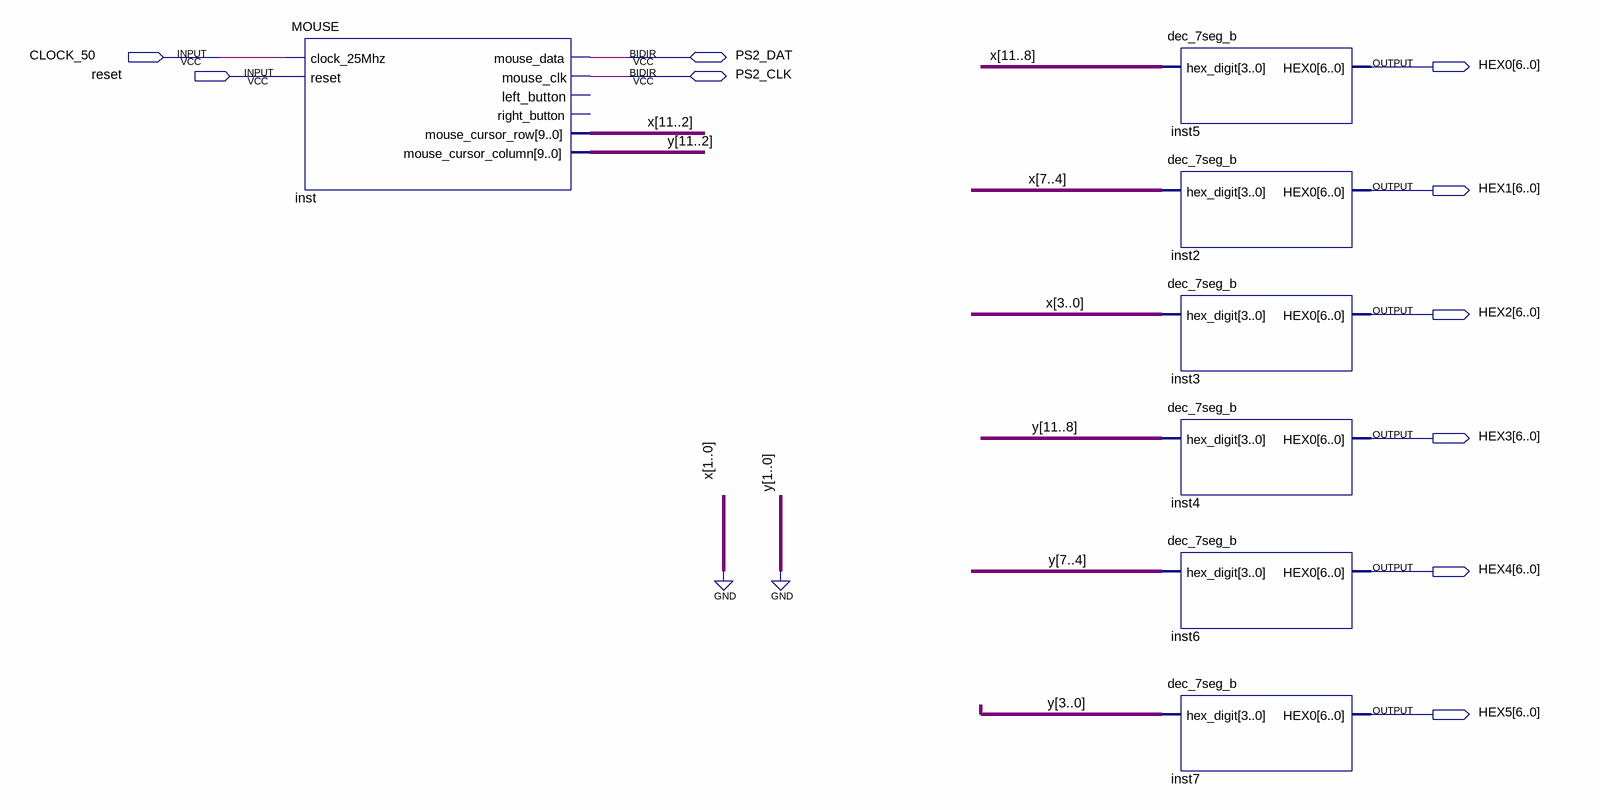
[diagram p0: schematic sheet]
// Quartus schematic MOUSE_position.bdf as structural Verilog: 7 symbols, 10 pins
module MOUSE_position (
  input  CLOCK_50,
  input  reset,
  inout  PS2_DAT,
  inout  PS2_CLK,
  output [6:0] HEX0,
  output [6:0] HEX1,
  output [6:0] HEX2,
  output [6:0] HEX3,
  output [6:0] HEX4,
  output [6:0] HEX5
);

  wire [11:2] x, y;

  MOUSE inst (
    .clock_25Mhz(CLOCK_50), .reset(reset), .mouse_cursor_row(x), .mouse_cursor_column(y),
    .mouse_data(PS2_DAT), .mouse_clk(PS2_CLK));  // open: left_button, right_button
  dec_7seg_b inst5 (.hex_digit(x[11:8]), .HEX0(HEX0));
  dec_7seg_b inst2 (.hex_digit(x[7:4]), .HEX0(HEX1));
  dec_7seg_b inst3 (.hex_digit({x[3:2], 2'b00}), .HEX0(HEX2));
  dec_7seg_b inst4 (.hex_digit(y[11:8]), .HEX0(HEX3));
  dec_7seg_b inst6 (.hex_digit(y[7:4]), .HEX0(HEX4));
  dec_7seg_b inst7 (.hex_digit({y[3:2], 2'b00}), .HEX0(HEX5));
endmodule
